# Altium schematic sheet MT-20S4A.SchDoc: MT-20S4A-2YLG
size 410 x 297 mm; ApprovedBy: Стерхов В.Д.; CheckedBy: Стерхов В.Д.; Author: Сергеев Д.А.; CompanyName: ГК СНАБЖЕНИЕ; DrawnBy: Сергеев Д.А.; Engineer: Сергеев Д.А.; Organization: ГК СНАБЖЕНИЕ; DocumentNumber: MT-20S4A-2YLG; Revision: 1; SheetNumber: 1; SheetTotal: 2
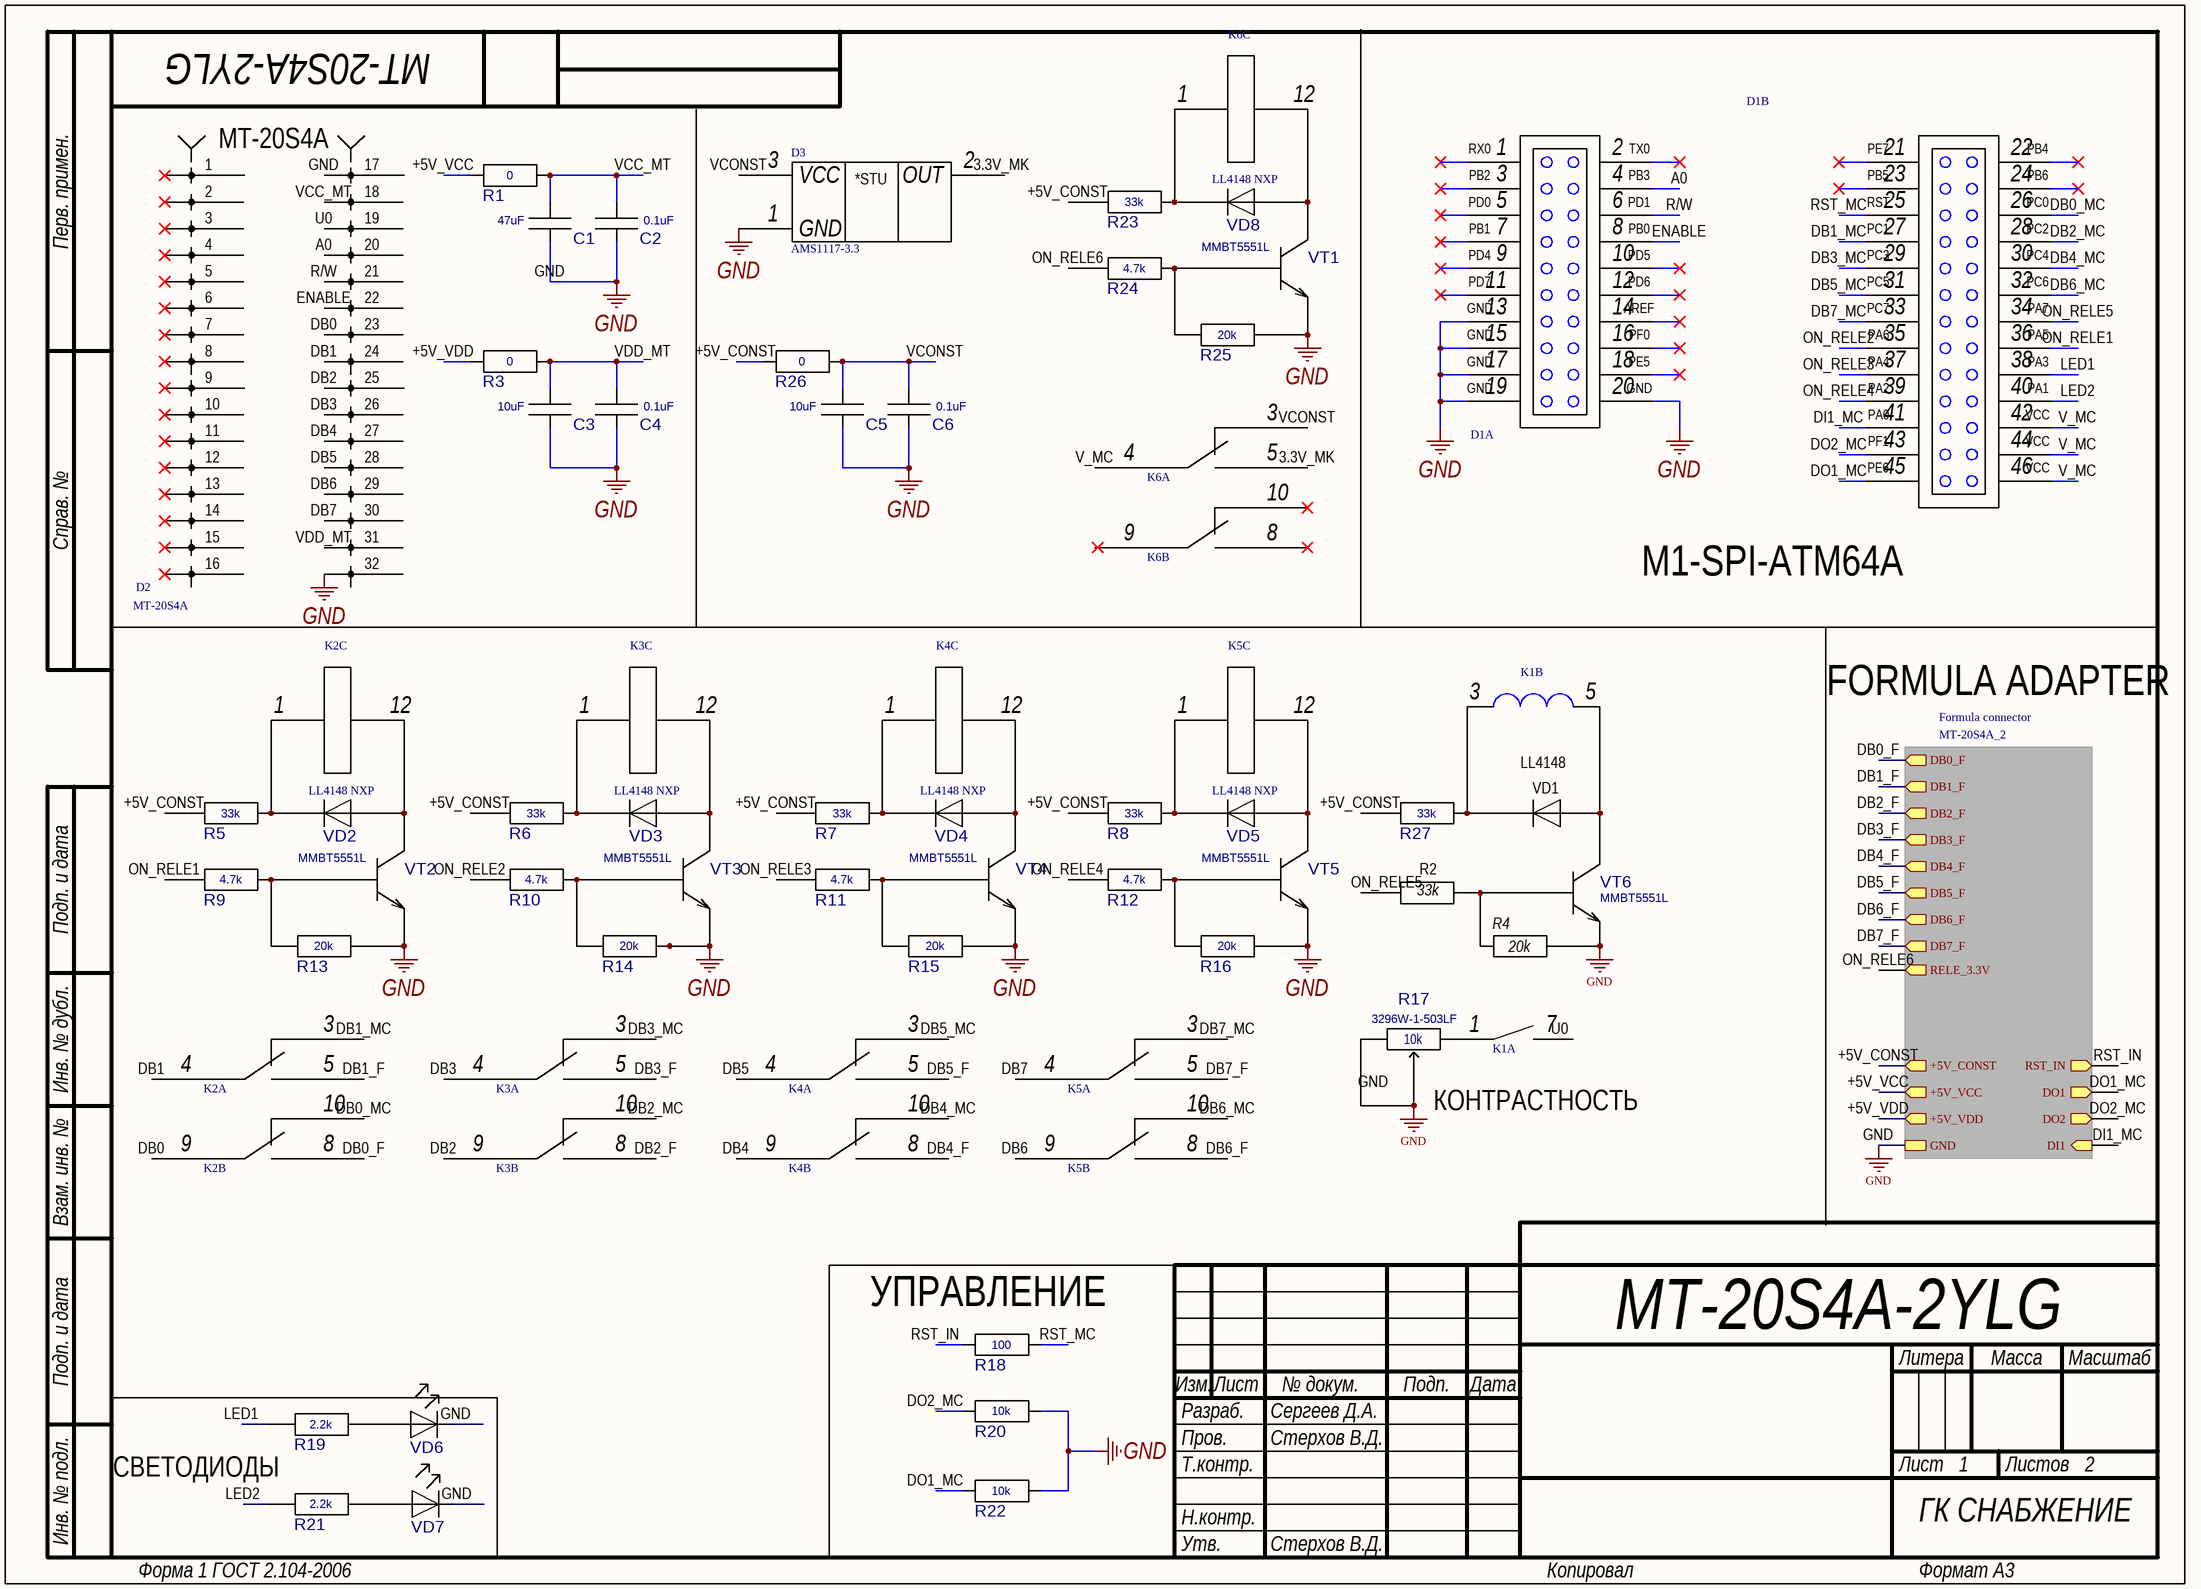
[diagram p0: MT-20S4A.SchDoc]

## Parts
C1  47uF  [0805]
C2  0.1uF  [0805]
C3  10uF  [0805]
C4  0.1uF  [0805]
C5  10uF  [0805]
C6  0.1uF  [0805]
D1  M1-SPI-ATM64  [M1-SPI-ATM64]  (value not drawn)  (parts A,B of 2)
D2  MT-20S4A  [MT-20S4A]
D3  AMS1117-3.3  [SOT-223]
K1  TRR1A05F00  [TRR1A05F00]  (value not drawn)  (parts A,B of 2)
K2  V23079A1001B301 TE  [V23079A1001B301]  (value not drawn)  (parts A,B,C of 3)
K3  V23079A1001B301 TE  [V23079A1001B301]  (value not drawn)  (parts A,B,C of 3)
K4  V23079A1001B301 TE  [V23079A1001B301]  (value not drawn)  (parts A,B,C of 3)
K5  V23079A1001B301 TE  [V23079A1001B301]  (value not drawn)  (parts A,B,C of 3)
K6  V23079A1001B301 TE  [V23079A1001B301]  (value not drawn)  (parts A,B,C of 3)
R1  0  [0805]
R2  33k  [0805]
R3  0  [0805]
R4  20k  [0805]
R5  33k  [0805]
R6  33k  [0805]
R7  33k  [0805]
R8  33k  [0805]
R9  4.7k  [0805]
R10  4.7k  [0805]
R11  4.7k  [0805]
R12  4.7k  [0805]
R13  20k  [0805]
R14  20k  [0805]
R15  20k  [0805]
R16  20k  [0805]
R17  3296W-1-503LF  value 10k  [3296X-1-503LF]
R18  100  [0805]
R19  2.2k  [0805]
R20  10k  [0805]
R21  2.2k  [0805]
R22  10k  [0805]
R23  33k  [0805]
R24  4.7k  [0805]
R25  20k  [0805]
R26  0  [0805]
R27  33k  [0805]
VD1  LL4148  [SOD80C]
VD2  LL4148 NXP  [SOD80C]
VD3  LL4148 NXP  [SOD80C]
VD4  LL4148 NXP  [SOD80C]
VD5  LL4148 NXP  [SOD80C]
VD6  LED(0805)  [0805(LED)]  (value not drawn)
VD7  LED(0805)  [0805(LED)]  (value not drawn)
VD8  LL4148 NXP  [SOD80C]
VT1  MMBT5551L  [SOT-23]
VT2  MMBT5551L  [SOT-23]
VT3  MMBT5551L  [SOT-23]
VT4  MMBT5551L  [SOT-23]
VT5  MMBT5551L  [SOT-23]
VT6  MMBT5551L  [SOT-23]

## Sub-sheets
Formula connector = MT-20S4A_2: DO1 (out), DO2 (out), DI1 (in), +5V_VCC (out), +5V_VDD (out), GND, +5V_CONST (out), DB0_F (out), DB1_F (out), DB2_F (out), DB3_F (out), DB4_F (out), DB5_F (out), DB6_F (out), DB7_F (out), RST_IN (out), RELE_3.3V (out)

## Nets
GND: C1.2 C2.2 C3.2 C4.2 C5.2 C6.2 D1.13 D1.15 D1.17 D1.19 D1.20 D2.17 D2.32 D3.1(GND) R4.1 R13.2 R14.2 R15.2 R16.2 R17.2 R17.3 R20.2 R22.2 R25.2 VD6.2(K) VD7.2(K) VT1.2(E) VT2.2(E) VT3.2(E) VT4.2(E) VT5.2(E) VT6.2(E) ; sheet Formula connector/GND
3.3V_MK: D3.2(OUT) K6.5
+5V_CONST: R5.1 R6.1 R7.1 R8.1 R23.1 R26.1 R27.1 ; sheet Formula connector/+5V_CONST
+5V_VCC: R1.1 ; sheet Formula connector/+5V_VCC
+5V_VDD: R3.1 ; sheet Formula connector/+5V_VDD
A0: D1.4 D2.20
DB0: D2.23 K2.9
DB0_F: K2.8 ; sheet Formula connector/DB0_F
DB0_MC: D1.26 K2.10
DB1: D2.24 K2.4
DB1_F: K2.5 ; sheet Formula connector/DB1_F
DB1_MC: D1.27 K2.3
DB2: D2.25 K3.9
DB2_F: K3.8 ; sheet Formula connector/DB2_F
DB2_MC: D1.28 K3.10
DB3: D2.26 K3.4
DB3_F: K3.5 ; sheet Formula connector/DB3_F
DB3_MC: D1.29 K3.3
DB4: D2.27 K4.9
DB4_F: K4.8 ; sheet Formula connector/DB4_F
DB4_MC: D1.30 K4.10
DB5: D2.28 K4.4
DB5_F: K4.5 ; sheet Formula connector/DB5_F
DB5_MC: D1.31 K4.3
DB6: D2.29 K5.9
DB6_F: K5.8 ; sheet Formula connector/DB6_F
DB6_MC: D1.32 K5.10
DB7: D2.30 K5.4
DB7_F: K5.5 ; sheet Formula connector/DB7_F
DB7_MC: D1.33 K5.3
DI1_MC: D1.41 ; sheet Formula connector/DI1
DO1_MC: D1.45 R22.1 ; sheet Formula connector/DO1
DO2_MC: D1.43 R20.1 ; sheet Formula connector/DO2
ENABLE: D1.8 D2.22
LED1: D1.38 R19.1
LED2: D1.40 R21.1
ON_RELE1: D1.36 R9.1
ON_RELE2: D1.35 R10.1
ON_RELE3: D1.37 R11.1
ON_RELE4: D1.39 R12.1
ON_RELE5: D1.34 R2.1
ON_RELE6: R24.1 ; sheet Formula connector/RELE_3.3V
R/W: D1.6 D2.21
RST_IN: R18.1 ; sheet Formula connector/RST_IN
RST_MC: D1.25 R18.2
U0: D2.19 K1.7
V_MC: D1.42 D1.44 D1.46 K6.4
VCC_MT: C1.1 C2.1 D2.18 R1.2
VCONST: C5.1 C6.1 D3.3(VCC) K6.3 R26.2
VDD_MT: C3.1 C4.1 D2.31 R3.2
NetK1_1: K1.1 R17.1
NetK1_3: K1.3 R27.2 VD1.2
NetK1_5: K1.5 VD1.1 VT6.3(K)
NetK2_1: K2.1 R5.2 VD2.2(K)
NetK2_12: K2.12 VD2.1(A) VT2.3(K)
NetK3_1: K3.1 R6.2 VD3.2(K)
NetK3_12: K3.12 VD3.1(A) VT3.3(K)
NetK4_1: K4.1 R7.2 VD4.2(K)
NetK4_12: K4.12 VD4.1(A) VT4.3(K)
NetK5_1: K5.1 R8.2 VD5.2(K)
NetK5_12: K5.12 VD5.1(A) VT5.3(K)
NetK6_1: K6.1 R23.2 VD8.2(K)
NetK6_12: K6.12 VD8.1(A) VT1.3(K)
NetR2_2: R2.2 R4.2 VT6.1(B)
NetR9_2: R9.2 R13.1 VT2.1(B)
NetR10_2: R10.2 R14.1 VT3.1(B)
NetR11_2: R11.2 R15.1 VT4.1(B)
NetR12_2: R12.2 R16.1 VT5.1(B)
NetR19_2: R19.2 VD6.1(A)
NetR21_2: R21.2 VD7.1(A)
NetR24_2: R24.2 R25.1 VT1.1(B)

Not connected (* = marked no-connect by the designer): D1 1* 2* 3* 5* 7* 9* 10* 11* 12* 14* 16* 18* 21* 22* 23* 24*; D2 1* 2* 3* 4* 5* 6* 7* 8* 9* 10* 11* 12* 13* 14* 15* 16*; K6 8* 9* 10*

## Notes on the sheet
- (near D2) MT-20S4A
- M1-SPI-ATM64A
- FORMULA ADAPTER
- КОНТРАСТНОСТЬ
- (near R18) УПРАВЛЕНИЕ
- СВЕТОДИОДЫ
- Labels drawn without touching a wire or pin: GND
- Перв. примен.
- Справ. №
- Подп. и дата
- Инв. № дубл.
- Взам. инв. №
- Разраб.
- Изм.
- Лист
- № докум.
- Подп.
- Дата
- Литера
- Масса
- Масштаб
- Пров.
- Т.контр.
- Листов
- Инв. № подл.
- Н.контр.
- Утв.
- Форма 1 ГОСТ 2.104-2006
- Копировал
- Формат А3
- (in symbol AMS1117-3.3 (SOT-223)) *STU
- (in symbol M1-SPI-ATM64, part A) RX0; TX0; PB2; PB3; PD0; PD1; PB1; PB0; PD4; PD5; PD7; PD6; GND; AREF; PF0; PE5
- (in symbol M1-SPI-ATM64, part B) PE7; PB4; PB5; PB6; RST; PC0; PC1; PC2; PC3; PC4; PC5; PC6; PC7; PA7; PA6; PA5; PA4; PA3; PA2; PA1; PA0; VCC; PF1; PE6

## Library data of the parts
C1-C6 = C0805: ComponentHeigt: 1.3; Firme: AVX; Leadform: SMD; KIND: Конденсатор; ClassName: *; Component Link: *; ComponentWeigt: *; Packaging: 0805; NN: *; Value: *
D3 = AMS1117-3.3 (SOT-223)
R1-R3 R5-R16 R18-R27 = R0805 Yageo: ComponentHeigt: 0.6; Firme: Yageo; Leadform: SMD; Kind: Резистор; ClassName: *; ComponentWeigt: *; Component Link: *; Packaging: 0805; NN: *; Value: *
R4 = RC0805 Yageo: ComponentHeigt: 0.6; Firme: Yageo; Leadform: SMD; Kind: Резистор; ClassName: *; ComponentWeigt: *; Component Link: *; Packaging: 0805; NN: *; Value: *
R17 = 3296X-1-503LF: ComponentHeigt: 0.6; Firme: Yageo; Leadform: SMD; Kind: Резистор; ClassName: *; ComponentWeigt: *; Component Link: *; Packaging: 0805; NN: *
VD1 = BAS32L (SOD-80C)
VD2-VD5 VD8 = LL4148 NXP: ComponentHeigt: 1.6; Leadform: SMD; NN: 24009301; KIND: Диод LL4148 NXP; Component Link: http://www.nxp.com; Packaging: SOD-80C; ClassName: *; Firme: NXP
VD6 VD7 = LED(0805): ComponentHeigt: 0.75; Leadform: в отверстия; Firme: Kingbright; NN: 24003000; KIND: Светодиод L-1154GD Kingbright; Component Link: *; ClassName: *
VT1-VT6 = MMBT5551L: ComponentHeigt: 1.1; Firme: ONS; Leadform: SMD; NN: 24007468; KIND: Транзистор MMBT5551L*G ONS; ClassName: *; ComponentWeigt: *; Packaging: SOT-23